# Altium schematic sheet Key_Buttons.SchDoc
size A4; DocumentNumber: 27; SheetNumber: 27; SheetTotal: 28
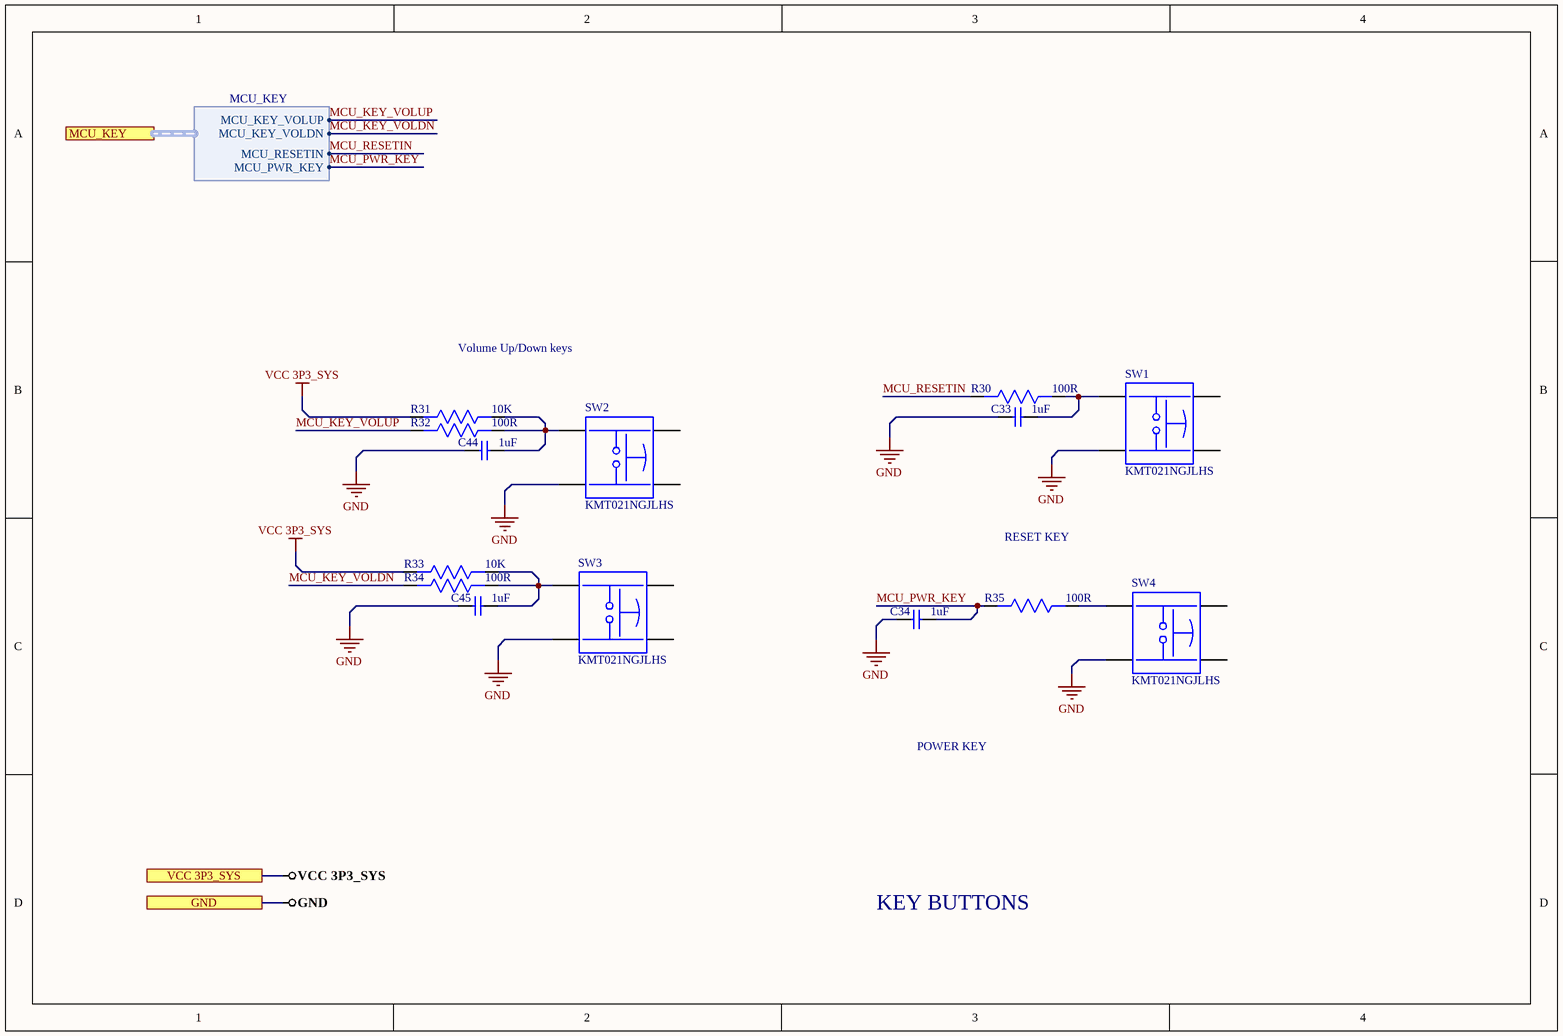
[diagram p0: Key_Buttons.SchDoc]

## Parts
C33  1uF  [Cap0603]
C34  1uF  [Cap0603]
C44  1uF  [Cap0603]
C45  1uF  [Cap0603]
R30  100R  [Res0603]
R31  10K  [Res0603]
R32  100R  [Res0603]
R33  10K  [Res0603]
R34  100R  [Res0603]
R35  100R  [Res0603]
SW1  KMT021NGJLHS  [KMT021NGJLHS]
SW2  KMT021NGJLHS  [KMT021NGJLHS]
SW3  KMT021NGJLHS  [KMT021NGJLHS]
SW4  KMT021NGJLHS  [KMT021NGJLHS]

## Ports
GND, MCU_KEY (harness MCU_KEY), VCC 3P3_SYS

## Harnesses
MCU_KEY: MCU_KEY_VOLUP, MCU_KEY_VOLDN, MCU_RESETIN, MCU_PWR_KEY

## Nets
GND: C33.1 C34.1 C44.1 C45.1 SW1.1 SW2.1 SW3.1 SW4.1 ; port GND
VCC 3P3_SYS: R31.2 R33.2 ; port VCC 3P3_SYS
MCU_KEY_VOLDN: R34.2 ; port MCU_KEY.MCU_KEY_VOLDN
MCU_KEY_VOLUP: R32.2 ; port MCU_KEY.MCU_KEY_VOLUP
MCU_PWR_KEY: C34.2 R35.2 ; port MCU_KEY.MCU_PWR_KEY
MCU_RESETIN: R30.2 ; port MCU_KEY.MCU_RESETIN
NetC33_2: C33.2 R30.1 SW1.3
NetC44_2: C44.2 R31.1 R32.1 SW2.3
NetC45_2: C45.2 R33.1 R34.1 SW3.3
NetR35_1: R35.1 SW4.3

Not connected (* = marked no-connect by the designer): SW1 2 4; SW2 2 4; SW3 2 4; SW4 2 4

## Notes on the sheet
- Volume Up/Down keys
- RESET KEY
- POWER KEY
- KEY BUTTONS

## Library data of the parts
C33 C34 C44 C45 = CC0603KRX5R8BB105: CAP CER 1UF 25V X5R 0603; Manufacturer: Yageo; Tolerance: 10%; Supplier 1: Digi-Key; Manufacturer Part Number: CC0603KRX5R8BB105; Stock 1: 459947; Pricing 1: 1=0.1, 10=0.076, 100=0.0337, 500=0.0241, 1000=0.01894 (USD); Mount: Surface Mount; Case/Package: 0603; Number of Pins: 2; Case Code (Metric): 1608; Case Code (Imperial): 0603; Min Operating Temperature: -55°C; Max Operating Temperature: 85°C; Capacitance: 1uF; Dielectric: X5R; Package Quantity: 1; Voltage Rating: 25V; Packaging: Tape and Reel; Termination: SMD/SMT; Voltage Rating (DC): 25V; Length: 1.6mm; Height: 0.8mm; Width: 0.031inch; Thickness: 0.035inch; Depth: 0.8mm; Radiation Hardening: No; REACH SVHC: No SVHC; Lead Free: Lead Free; Halogen Free: Halogen Free; ComponentLink1URL: http://www.yageo.com/documents/recent/UPY-GPHC_X5R_4V-to-50V_25.pdf?src-supplier=Digi-Key; ComponentLink1Description: http://www.yageo.com/documents/recent/UPY-GPHC_X5R_4V-to-50V_25.pdf?src-supplier=Digi-Key; ComponentLink2URL: http://www.yageo.com/documents/recent/UPY-GPHC_X5R_4V-to-50V_12.pdf?src-supplier=Avnet+Europe; ComponentLink2Description: http://www.yageo.com/documents/recent/UPY-GPHC_X5R_4V-to-50V_12.pdf?src-supplier=Avnet+Europe; ComponentLink3URL: http://www.farnell.com/datasheets/1525783.pdf?src-supplier=Element14; ComponentLink3Description: http://www.farnell.com/datasheets/1525783.pdf?src-supplier=Element14; ComponentLink4URL: http://www.yageo.com/documents/recent/UPY-GPHC_X5R_4V-to-50V_12.pdf?src-supplier=Avnet; ComponentLink4Description: http://www.yageo.com/documents/recent/UPY-GPHC_X5R_4V-to-50V_12.pdf?src-supplier=Avnet; Supplier Part Number 1: 311-1445-1-ND
R30 R32 R34 R35 = RC0603FR-07100RL: RES SMD 100 OHM 1% 1/10W 0603; Manufacturer: Yageo; Temperature Coefficient: 100ppm/°C; Voltage Rating (DC): 50V; Power Rating: 100mW; Supplier 1: Arrow Electronics; Manufacturer Part Number: RC0603FR-07100RL; RoHS: Yes; Category: Chip SMD Resistors; Stock 1: 3800000; Pricing 1: 5000=0.00300, 5000=0.00200, 5000=0.00450, 50000=0.00410, 500000=0.00230, 2500000=0.00140 (USD); Case/Package: 0603; Number of Pins: 2; Case Code (Imperial): 0603; Case Code (Metric): 1608; Size Code: 0603; Min Operating Temperature: -55°C; Max Operating Temperature: 155°C; Resistance: 100R; Tolerance: 1%; Resistor Type: Thick Film; Packaging: Tape and Reel; Voltage Rating: 50V; Termination: SMD/SMT; Features: Moisture Resistant; Series: RC; Max Power Dissipation: 100mW; Number of Terminations: 2; Construction: Rectangular; Resistance Tolerance: 1%; Technology: THICK FILM; Length: 1.6mm; Width: 0.8mm; Height: 0.45mm; Depth: 0.8mm; REACH SVHC: Unknown; Lead Free: Lead Free; RoHS Compliant: Yes; Military Standard: Not; Supplier Part Number 1: RC0603FR-07100RL
R31 R33 = AC0603JR-0710KL: RES SMD 10K OHM 5% 1/10W 0603; Manufacturer: Yageo; Voltage Rating: 50V; Resistance: 10kR; Power Rating: 100mW; Temperature Coefficient: 100ppm/°C; Supplier 1: Future Electronics; Manufacturer Part Number: AC0603JR-0710KL; RoHS: Yes; Category: Chip SMD Resistors; Stock 1: 1533000; Pricing 1: 5000=0.00540 (USD); Case/Package: 0603; Case Code (Imperial): 0603; Case Code (Metric): 1608; Size Code: 0603; Min Operating Temperature: -55°C; Max Operating Temperature: 155°C; Packaging: Tape and Reel; Tolerance: 5%; Package Quantity: 1; Resistor Type: Thick Film; Termination: SMD/SMT; Number of Terminations: 2; Max Power Dissipation: 100mW; Features: Moisture Resistant,Automotive AEC-Q200,Anti-Sulfur; Series: AC; Construction: Rectangular; Length: 0.063inch; Width: 0.031inch; Height: 0.022inch; Depth: 0.8mm; Military Standard: Not; Lead Free: Lead Free; RoHS Compliant: Yes; ComponentLink1URL: https://datasheet.ciiva.com/5562/pyu-ac-51-rohs-l-2-5562553.pdf?src-supplier=Mouser; ComponentLink1Description: https://datasheet.ciiva.com/5562/pyu-ac-51-rohs-l-2-5562553.pdf?src-supplier=Mouser; Supplier Part Number 1: 1029044
SW1-SW4 = KMT021NGJLHS: SWITCH TACTILE SPST-NO 0.05A 32V; Manufacturer: ITT C&K; Mechanical Life: 300000Cycles; Operating Force: 1.6N; Throw Configuration: SPST; Max Current Rating: 50mA; Power Rating: 500mW; Illumination Type: Non-Illuminated,Illuminated; Switch Travel: 0.15mm; Switch Function: Off-Mom; Actuator Type: Standard; Ratings: IP68,Waterproof,Dust Tight; Supplier 1: Digi-Key; Manufacturer Part Number: KMT021NGJLHS; RoHS: Yes; Category: Tactile Switches; Stock 1: 5223; Pricing 1: 1=0.30000, 10=0.29500, 25=0.27960, 100=0.25310, 250=0.23076, 500=0.21448, 1000=0.18297, 2500=0.17789 (USD); Mount: Surface Mount; Case/Package: SMD/SMT; Contact Material: Silver; Contact Plating: Silver; Min Operating Temperature: -40°C; Max Operating Temperature: 85°C; Max Voltage Rating (DC): 32V; Termination: J-Lead; Packaging: Tape and Reel; Package Quantity: 5000; Voltage Rating (DC): 32V; Current Rating: 50mA; Orientation: Straight; Series: KMT0; Length: 2.6mm; Depth: 3.4mm; Radiation Hardening: No; REACH SVHC: No SVHC; Lead Free: Lead Free; RoHS Compliant: Yes; ComponentLink1URL: https://datasheet.ciiva.com/5684/1443640-5684448.pdf?src-supplier=Farnell; ComponentLink1Description: https://datasheet.ciiva.com/5684/1443640-5684448.pdf?src-supplier=Farnell; ComponentLink2URL: https://datasheet.ciiva.com/2900/kmt-0xx-ngj-lhs-drawing-2900147.pdf?src-supplier=Digi-Key; ComponentLink2Description: https://datasheet.ciiva.com/2900/kmt-0xx-ngj-lhs-drawing-2900147.pdf?src-supplier=Digi-Key; ComponentLink3URL: https://datasheet.ciiva.com/2900/kmt-0xx-ngj-lhs-drawing-2900148.pdf?src-supplier=Digi-Key; ComponentLink3Description: https://datasheet.ciiva.com/2900/kmt-0xx-ngj-lhs-drawing-2900148.pdf?src-supplier=Digi-Key; ComponentLink4URL: https://datasheet.ciiva.com/2900/kmt-0xx-ngj-lhs-drawing-2900149.pdf?src-supplier=Digi-Key; ComponentLink4Description: https://datasheet.ciiva.com/2900/kmt-0xx-ngj-lhs-drawing-2900149.pdf?src-supplier=Digi-Key; ComponentLink5URL: https://datasheet.ciiva.com/22712/1443640-22712102.pdf?src-supplier=Element14; ComponentLink5Description: https://datasheet.ciiva.com/22712/1443640-22712102.pdf?src-supplier=Element14; ComponentLink6URL: https://datasheet.ciiva.com/7986/1443640-7986975.pdf?src-supplier=Element14; ComponentLink6Description: https://datasheet.ciiva.com/7986/1443640-7986975.pdf?src-supplier=Element14; Supplier Part Number 1: CKN10289CT-ND